# Altium schematic sheet Transmitter_PCB3.SchDoc
size A; SPICEModelCacheIJPDMXRA: <root> / <DocumentId>IJPDMXRA</DocumentId> / <CacheFrame Number="0"> / <Model Name="irf540n" Kind="CKT"> / <Text>* SPICE3 MODEL WITH THERMAL RC NETWORK / ************************************** / *      Model Generated by MODPEX     * / *Copyright(c) Symmetry Design Systems* / *         All Rights Reserved        * / *    UNPUBLISHED LICENSED SOFTWARE   * / *   Contains Proprietary Information * / *      Which is The Property of      * / *     SYMMETRY OR ITS LICENSORS      * / *Commercial Use or Resale Restricted * / *   by Symmetry License Agreement    * / ************************************** / * Model generated on Sep  5, 01 / * MODEL FORMAT: SPICE3 / * Symmetry POWER MOS Model (Version 1.0) / * External Node Designations / * Node 1 -&gt; Drain / * Node 2 -&gt; Gate / * Node 3 -&gt; Source / .SUBCKT irf540n 1 2 3 / M1 9 7 8 8 MM L=100u W=100u / .MODEL MM NMOS (LEVEL=1 IS=1e-32 / +VTO=3.58173 LAMBDA=0.00806114 KP=112.25 / +CGSO=1.896e-05 CGDO=1e-11) / RS 8 3 0.025918 / D1 3 1 MD / .MODEL MD D (IS=1.565e-11 RS=0.006486 N=1.1328 BV=100 / +IBV=0.00025 EG=1.2 XTI=3.32496 TT=0 / +CJO=1.16e-09 VJ=3.16363 M=0.840542 FC=0.5) / RDS 3 1 1e+06 / RD 9 1 0.0130608 / RG 2 7 6.45271 / D2 4 5 MD1 / * Default values used in MD1: / *   RS=0 EG=1.11 XTI=3.0 TT=0 / *   BV=infinite IBV=1mA / .MODEL MD1 D (IS=1e-32 N=50 / +CJO=1.30485e-09 VJ=0.899032 M=0.899999 FC=1e-08) / D3 0 5 MD2 / * Default values used in MD2: / *   EG=1.11 XTI=3.0 TT=0 CJO=0 / *   BV=infinite IBV=1mA / .MODEL MD2 D (IS=1e-10 N=0.4 RS=3e-06) / RL 5 10 1 / FI2 7 9 VFI2 -1 / VFI2 4 0 0 / EV16 10 0 9 7 1 / CAP 11 10 2.35428e-09 / FI1 7 9 VFI1 -1 / VFI1 11 6 0 / RCAP 6 10 1 / D4 0 6 MD3 / * Default values used in MD3: / *   EG=1.11 XTI=3.0 TT=0 CJO=0 / *   RS=0 BV=infinite IBV=1mA / .MODEL MD3 D (IS=1e-10 N=0.4) / .ENDS irf540n</Text> / </Model> / </CacheFrame> / </root>
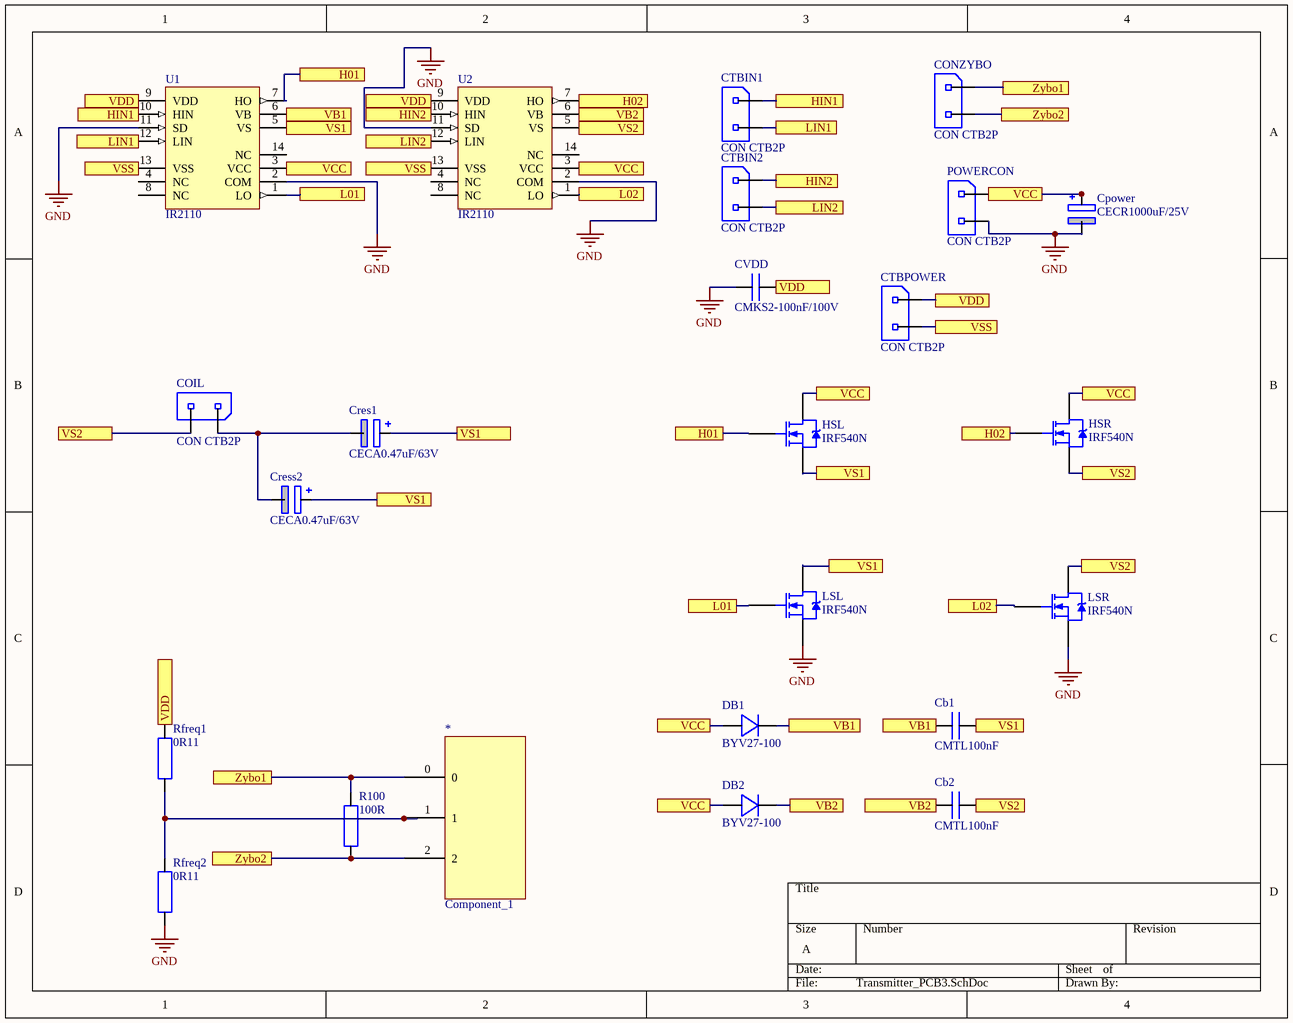
[diagram p0: Transmitter_PCB3.SchDoc]

## Parts
*  Component_1  [PCBComponent_1]
Cb1  CMTL100nF  [cap 1 (.25/.08/.2/80/36)]
Cb2  CMTL100nF  [cap 1 (.25/.08/.2/80/36)]
COIL  CON CTB2P  [contactbrug 2]
CONZYBO  CON CTB2P  [contactbrug 2]
Cpower  CECR1000uF/25V  [cap 64 pol (D.4/.2/80/36)]
Cres1  CECA0.47uF/63V  [cap 48 pol (.46/.2/.6/125/36)]
Cress2  CECA0.47uF/63V  [cap 48 pol (.46/.2/.6/125/36)]
CTBIN1  CON CTB2P  [contactbrug 2]
CTBIN2  CON CTB2P  [contactbrug 2]
CTBPOWER  CON CTB2P  [contactbrug 2]
CVDD  CMKS2-100nF/100V  [cap 26 (.28/.14/.2/80/32)]
DB1  BYV27-100  [SOD-57]
DB2  BYV27-100  [SOD-57]
HSL  IRF540N  [TO-220AB]
HSR  IRF540N  [TO-220AB]
LSL  IRF540N  [TO-220AB]
LSR  IRF540N  [TO-220AB]
POWERCON  CON CTB2P  [contactbrug 2]
R100  100R  [ws 0.6W H]
Rfreq1  0R11  [ws 0.6W H]
Rfreq2  0R11  [ws 0.6W H]
U1  IR2110  [PDIP14]
U2  IR2110  [PDIP14]

## Ports
H01, H02, HIN1, HIN2, L01, L02, LIN1, LIN2, VB1, VB2, VCC, VDD, VS1, VS2, VSS, Zybo1, Zybo2

## Nets
GND: Cpower.2 CVDD.1 LSL.3(S) LSR.3(S) POWERCON.2 Rfreq2.1 U1.2(COM) U1.11(SD) U2.2(COM) U2.11(SD)
H01: HSL.1(G) U1.7(HO) ; port H01
H02: HSR.1(G) U2.7(HO) ; port H02
HIN1: CTBIN1.1 U1.10(HIN) ; port HIN1
HIN2: CTBIN2.1 U2.10(HIN) ; port HIN2
L01: LSL.1(G) U1.1(LO) ; port L01
L02: LSR.1(G) U2.1(LO) ; port L02
LIN1: CTBIN1.2 U1.12(LIN) ; port LIN1
LIN2: CTBIN2.2 U2.12(LIN) ; port LIN2
VB1: Cb1.1 DB1.2 U1.6(VB) ; port VB1
VB2: Cb2.1 DB2.2 U2.6(VB) ; port VB2
VCC: Cpower.1 DB1.1 DB2.1 HSL.2(D) HSR.2(D) POWERCON.1 U1.3(VCC) U2.3(VCC) ; port VCC
VDD: CTBPOWER.1 CVDD.2 Rfreq1.2 U1.9(VDD) U2.9(VDD) ; port VDD
VS1: Cb1.2 Cres1.1 Cress2.1 HSL.3(S) LSL.2(D) U1.5(VS) ; port VS1
VS2: Cb2.2 COIL.2 HSR.3(S) LSR.2(D) U2.5(VS) ; port VS2
VSS: CTBPOWER.2 U1.13(VSS) U2.13(VSS) ; port VSS
Zybo1: *.0 CONZYBO.1 R100.2 ; port Zybo1
Zybo2: *.2 CONZYBO.2 R100.1 ; port Zybo2
Net*_1: *.1 Rfreq1.1 Rfreq2.2
NetCOIL_1: COIL.1 Cres1.2 Cress2.2

Not connected (* = marked no-connect by the designer): U1 4(NC) 8(NC) 14(NC); U2 4(NC) 8(NC) 14(NC)

## Library data of the parts
Cb1 Cb2 = CMTL100nF: multilayer capaciteit 100nF/63V; Part Number: CMTL100nF; Component Kind: Standard; Component Type: Standard; Designator: CMTL100nF; Pin Count: 2; Supplier 1: Farnell
COIL CONZYBO CTBIN1 CTBIN2 CTBPOWER POWERCON = CON CTB2P: contactbrug vast 2 pin; Part Number: CON CTB2P; Component Kind: Standard; Component Type: Standard; Designator: CON CTB2P; Pin Count: 2; Supplier 1: Farnell
Cpower = CECR1000uF/25V: elektrolytische condensator radiaal 1000uF/25V; Supplier 1: Farnell
Cres1 Cress2 = CECA0.47uF/63V: elektrolytische condensator axiaal 0.47uF/63V; Part Number: CECA0.47uF/63V; Component Kind: Standard; Component Type: Standard; Designator: CECA0.47uF/63V; Pin Count: 2; Supplier 1: Farnell
CVDD = CMKS2-100nF/100V: gemetaliseerde polyester capaciteit 100nF/100V, Wima MKS2; Part Number: CMKS2-100nF/100V; Component Kind: Standard; Component Type: Standard; Designator: CMKS2-100nF/100V; Pin Count: 2; Supplier 1: Farnell
DB1 DB2 = BYV27-100: ultra fast low-loss controlled avalanche rectifier; Part Number: BYV27-100; Component Kind: Standard; Component Type: Standard; Designator: BYV27-100; Pin Count: 2; Supplier 1: Farnell
HSL HSR LSL LSR = IRF540N: HEXFET Power MOSFET; Note: Pin 2 is electrically connected to pin 4.; Sim Note: Thermal Model provided is not called on from main Subckt.; Published: 8-Jun-2000; LatestRevisionDate: 17-Jul-2002; LatestRevisionNote: Re-released for DXP Platform.; DatasheetVersion: May-1998; PackageVersion: Feb-1997; PackageReference: TO-220AB; Publisher: Altium Limited; PackageDescription: TO, Thru-Hole, Vertical, Heatsink Mounted; 3 In-Line Leads; Pitch 2.54 mm; ComponentLink1Description: Manufacturer Link; ComponentLink1URL: http://www.irf.com/; ComponentLink2Description: Datasheet; ComponentLink2URL: http://www.irf.com/product-info/datasheets/data/irf540n.pdf
R100 = 100R: weerstand 100R 0.6W; Supplier 1: Farnell
Rfreq1 Rfreq2 = 0R11: weerstand 0R11 0.6W; Supplier 1: Farnell
U1 U2 = IR2110: High and Low Side Driver; Note: Pins 4, 8 and 14 are not connected; Published: 8-Jun-2000; LatestRevisionDate: 04-Mar-2005; LatestRevisionNote: Stylized 3D Model Added.; DatasheetVersion: PD60147J; PackageReference: PDIP14; Publisher: Altium Limited; PackageDescription: DIP; 14 Leads; Row Spacing 7.62 mm; Pitch 2.54 mm; ComponentLink1Description: Manufacturer Link; ComponentLink1URL: http://www.irf.com/; ComponentLink2Description: Datasheet; ComponentLink2URL: http://www.irf.com/product-info/datasheets/data/ir2110.pdf